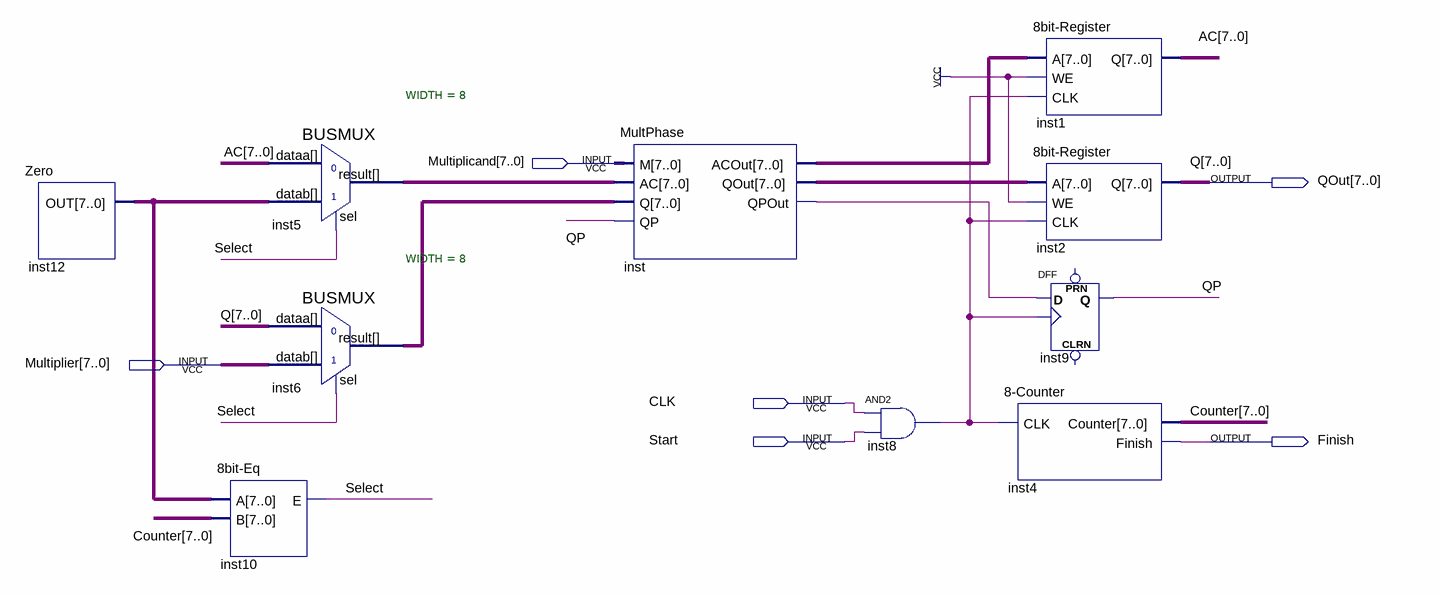
[diagram p0: schematic sheet]
// Quartus schematic MultMulticycle.bdf as structural Verilog: 10 symbols, 6 pins
module MultMulticycle (
  input  [7:0] Multiplicand,
  input  [7:0] Multiplier,
  input  CLK,
  input  Start,
  output [7:0] QOut,
  output Finish
);

  wire inst8_out, inst_qpout, QP, Select;
  wire [7:0] AC, Counter, inst5_result, inst6_result, inst12_out, inst_acout, inst_qout;

  Zero inst12 (.OUT(inst12_out));
  BUSMUX #(.WIDTH(8)) inst5 (.datab(inst12_out), .sel(Select), .dataa(AC), .result(inst5_result));
  BUSMUX #(.WIDTH(8)) inst6 (.datab(Multiplier), .sel(Select), .dataa(QOut), .result(inst6_result));
  \8bit-Eq  inst10 (.A(inst12_out), .B(Counter), .E(Select));
  MultPhase inst (
    .M(Multiplicand), .AC(inst5_result), .Q(inst6_result), .QP(QP), .ACOut(inst_acout), .QOut(inst_qout),
    .QPOut(inst_qpout));
  and inst8 (inst8_out, CLK, Start);
  \8bit-Register  inst1 (.A(inst_acout), .WE(1'b1), .CLK(inst8_out), .Q(AC));
  \8bit-Register  inst2 (.A(inst_qout), .WE(1'b1), .CLK(inst8_out), .Q(QOut));
  DFF inst9 (.CLK(inst8_out), .D(inst_qpout), .Q(QP));  // open: CLRN, PRN
  \8-Counter  inst4 (.CLK(inst8_out), .Counter(Counter), .Finish(Finish));

  // Other names for the same wires on the sheet: Q[7:0] = QOut
endmodule
